# EasyEDA Pro project ProPrj_bizhang car_2026-04-26.epro

# Schematic Schematic1
Board Name: Board1; Create Date: 2025-07-30; Page Name: P1; Project Name: bizhang car; Schematic Name: Schematic1; Update Date: 2025-08-14; BladeWidth: 10; Company: 嘉立创EDA; Page Size: A4; RegionStart: 1; ShowBorder: 1; TitleBlock: 1; TitleBlockPosition: 3; Version: V1.0; XRegionCount: 6; YRegionCount: 4
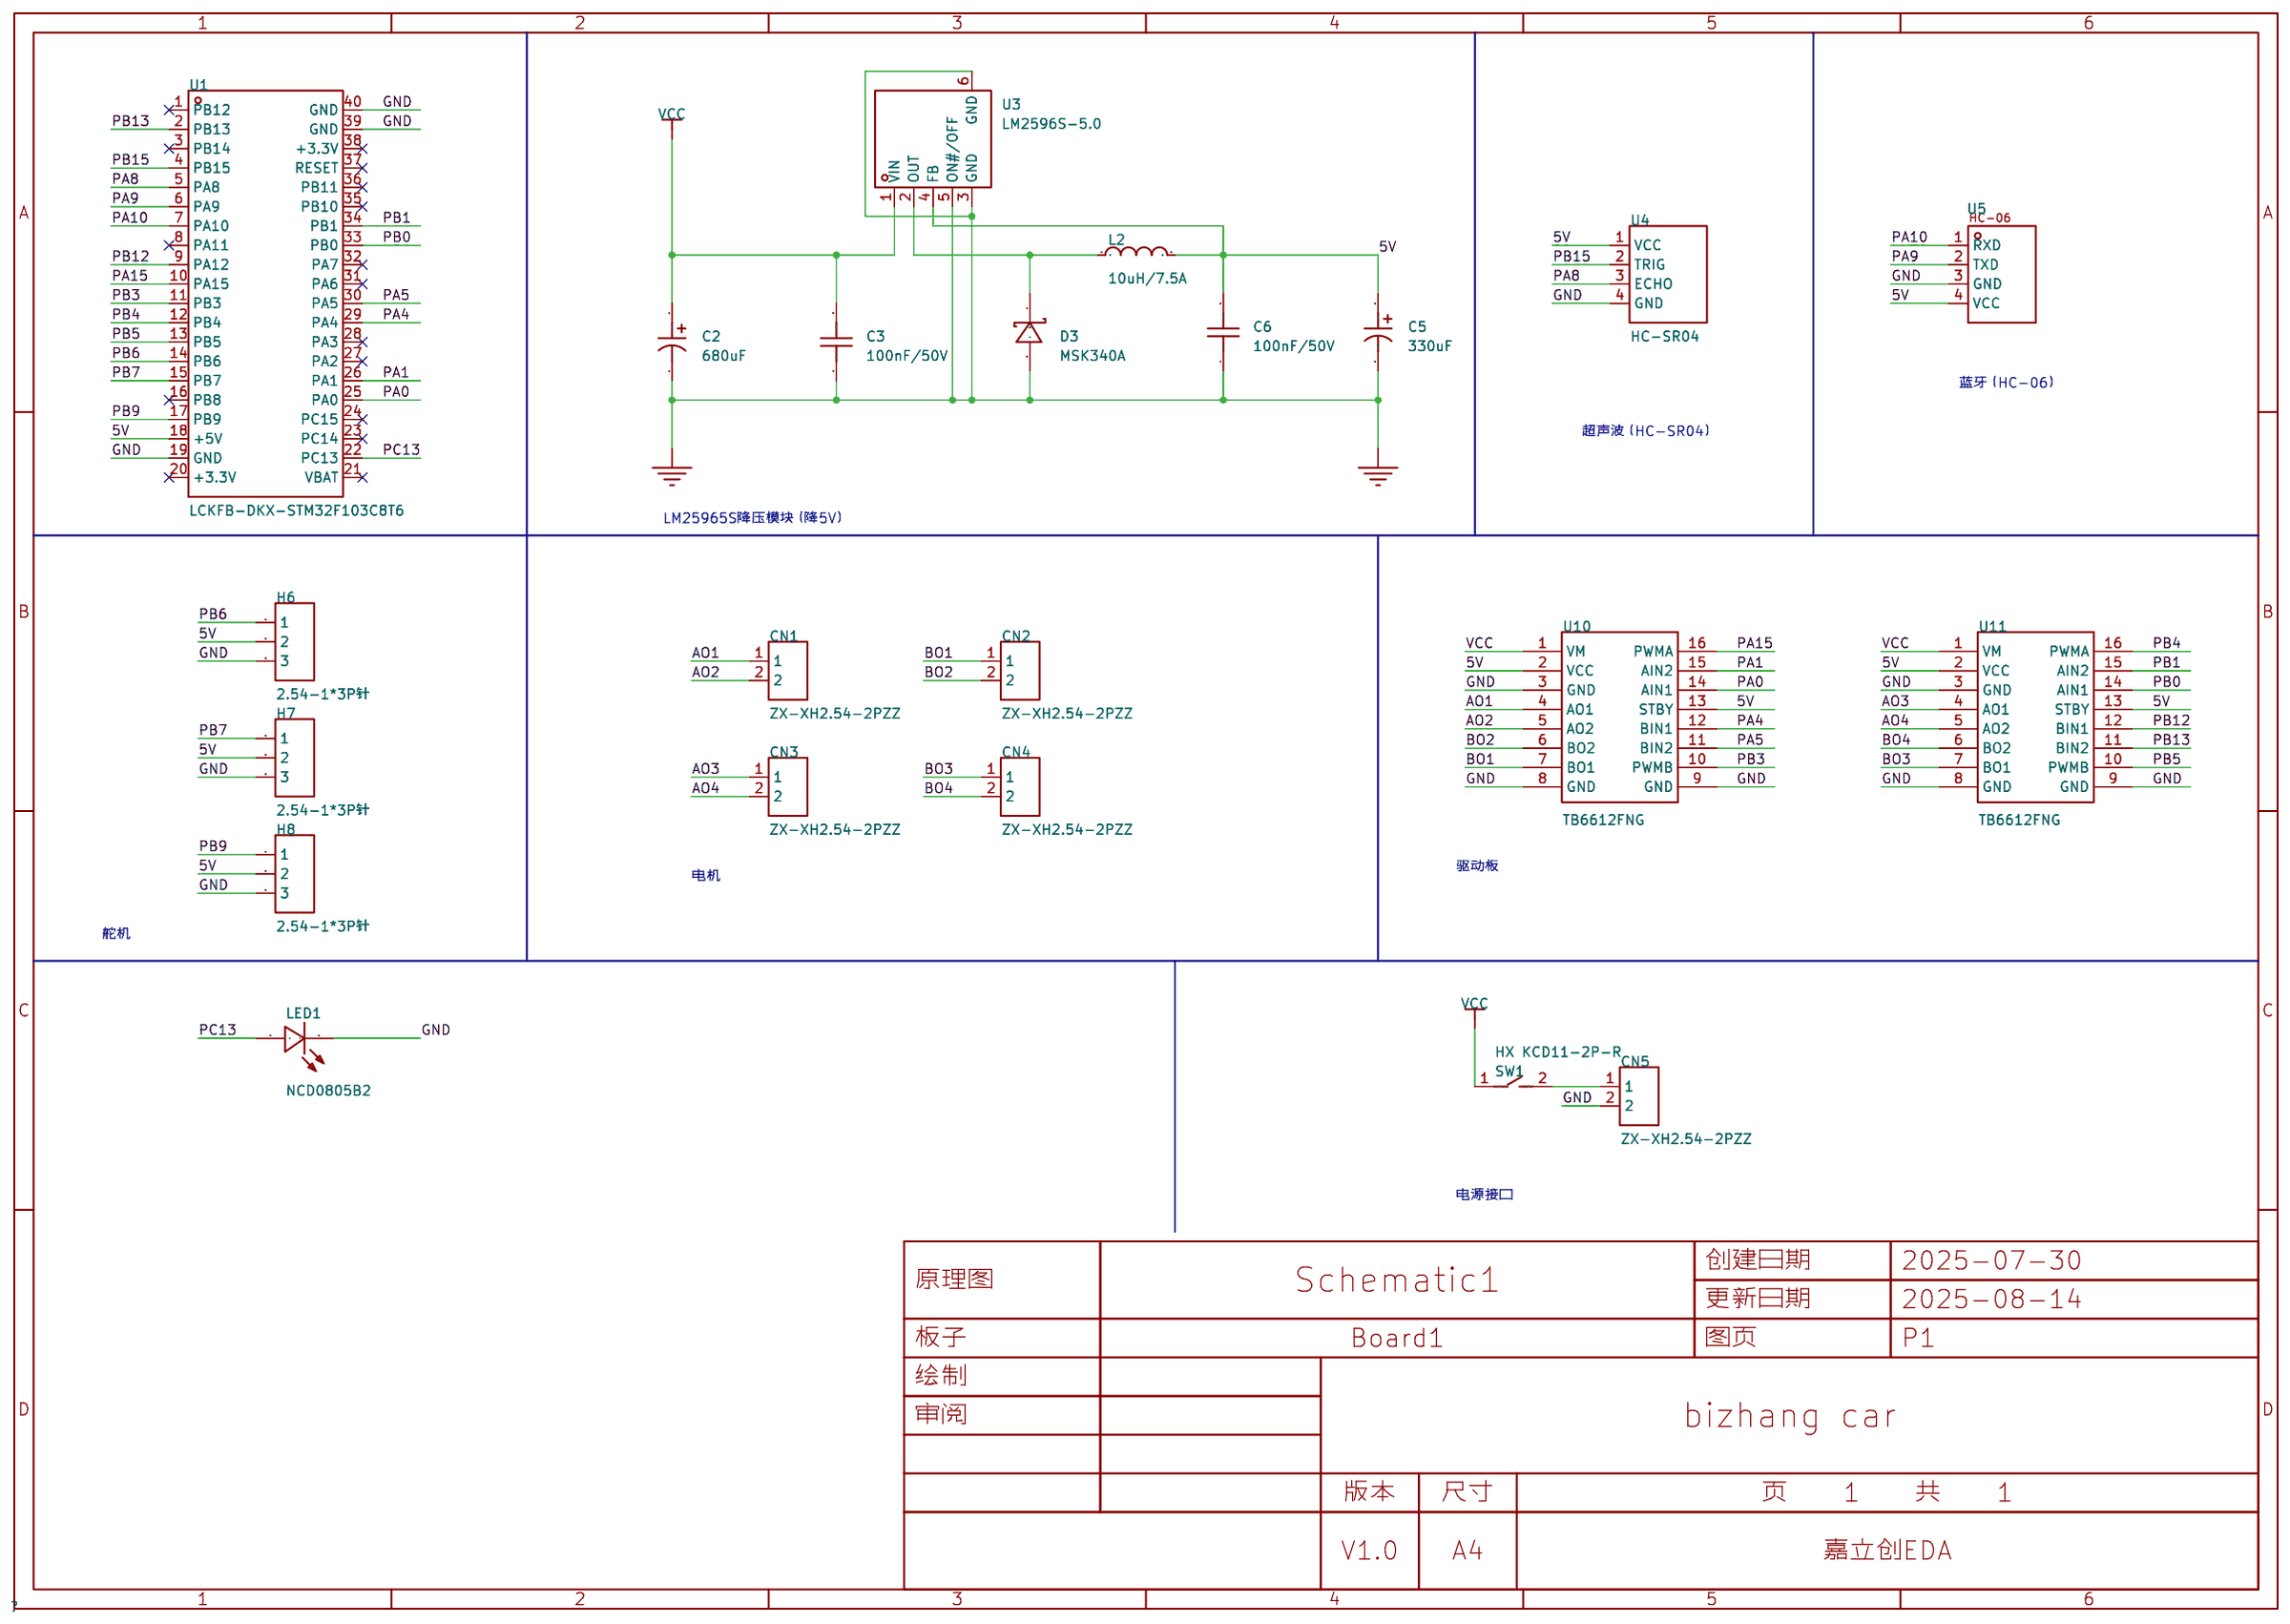
[diagram p0: schematic sheet]

## Parts
C2  680uF  [CAP-TH_BD13.0-P5.00-D0.6-FD]
C3  100nF/50V  [C0805]
C5  330uF  [CAP-TH_BD8.0-P3.50-D0.6-FD]
C6  100nF/50V  [C0805]
CN1  ZX-XH2.54-2PZZ  [CONN-TH_2P-P2.50_HX25003-2A]
CN2  ZX-XH2.54-2PZZ  [CONN-TH_2P-P2.50_HX25003-2A]
CN3  ZX-XH2.54-2PZZ  [CONN-TH_2P-P2.50_HX25003-2A]
CN4  ZX-XH2.54-2PZZ  [CONN-TH_2P-P2.50_HX25003-2A]
CN5  ZX-XH2.54-2PZZ  [CONN-TH_2P-P2.50_HX25003-2A]
D3  MSK340A  [SMA_L4.4-W2.6-LS5.0-RD]
H6  2.54-1*3P针  [HDR-TH_3P-P2.54-V-M-1]
H7  2.54-1*3P针  [HDR-TH_3P-P2.54-V-M-1]
H8  2.54-1*3P针  [HDR-TH_3P-P2.54-V-M-1]
L2  10uH/7.5A  [IND-SMD_L11.0-W10.2]
LED1  NCD0805B2  [LED0805-R-RD]
SW1  HX KCD11-2P-R  [SW-TH_2P-L15.0-W10.5-P5.00_KCD11-2P-R]
U1  LCKFB-DKX-STM32F103C8T6  [CONN-TH_L53.3-W22.9_STM32F103C8T6-CARD]
U3  LM2596S-5.0  [TO-263-5_L10.1-W8.7-P1.70-LS15.2-BR]
U4  HC-SR04  [TH_HC-SR04V]
U5  -  [HC-06]
U10  TB6612FNG  [TB6612FNG]
U11  TB6612FNG  [TB6612FNG]

## Library data of the parts
C2 = ERG50V680M13X21: 容值:680uF;精度:±20%;额定电压:50V;纹波电流:2.18A@100kHz;等效串联电阻(ESR):30mΩ@100kHz;; LCSC Part Name: 680uF ±20% 50V; Supplier Part: C48935384; Manufacturer: 捷而瑞; Supplier Footprint: 插件,D13xL21mm; JLCPCB Part Class: 扩展库; Datasheet: https://atta.szlcsc.com/upload/public/pdf/source/20250526/717B4C76834FE5C4A331D19A222D031C.pdf; Supplier: LCSC; Tolerance: ±20%; Voltage Rating: 50V; Ripple Current: 2.18A@100kHz; Equivalent Series Resistance(ESR): 30mΩ@100kHz; Pin Spacing: 5mm; Diameter: 13mm; Height - Seated (Max): 21mm; Lifetime: 2000hrs@105℃; Operating Temperature: -40℃~+105℃
C3 C6 = CAP_0805: Supplier Footprint: 0805
C5 = ERG25V330M8X12: 容值:330uF;精度:±20%;额定电压:25V;纹波电流:760mA@100kHz;等效串联电阻(ESR):87mΩ@100kHz;; LCSC Part Name: 330uF ±20% 25V; Supplier Part: C47344178; Manufacturer: 捷而瑞; Supplier Footprint: 插件,D8xL12mm; JLCPCB Part Class: 扩展库; Datasheet: https://atta.szlcsc.com/upload/public/pdf/source/20250526/717B4C76834FE5C4A331D19A222D031C.pdf; Supplier: LCSC; Tolerance: ±20%; Voltage Rating: 25V; Ripple Current: 760mA@100kHz; Equivalent Series Resistance(ESR): 87mΩ@100kHz; Pin Spacing: 3.5mm; Diameter: 8mm; Height - Seated (Max): 12mm; Lifetime: 2000hrs@105℃; Operating Temperature: -40℃~+105℃
CN1-CN5 = ZX-XH2.54-2PZZ: 插针结构:1x2P;间距:2.5mm;安装方式:直插;参考系列:XH;总PIN数:2P;排数:1;每排PIN数:2;行距:-;额定电流:3A;触头材质:黄铜;触头镀层:锡;工作温度:-25℃~+85℃;; LCSC Part Name: 1x2P 间距:2.5mm 直插 系列:XH; Supplier Part: C7429632; Manufacturer: Megastar(兆星); Supplier Footprint: 插件,P=2.5mm; JLCPCB Part Class: 扩展库; Datasheet: https://item.szlcsc.com/datasheet/ZX-XH2.54-2PZZ/8427549.html; Supplier: LCSC; Pins Structure: 1x2P; Pitch: 2.5mm; Mounting Type: 直插; Reference Series: XH; Number of Pins: 2P; Number of Rows: 1; Number of PINs Per Row: 2; Current Rating: 3A; Contact Material: 黄铜; Contact Plating: 锡; Operating Temperature: -25℃~+85℃; Voltage Rating: 250V; Plastic Material: PA66; Flame Retardant Rating: UL94V-0; Color: 白色; Z-Height of the Board: 7mm; X-Length of Bottom Edge on Board (Spacing Line): 7.5mm; Y-Width of Bottom Edge on Board: 5.9mm
D3 = MSK340A: 二极管配置:独立式;正向压降(Vf):460mV@5A;直流反向耐压(Vr):50V;平均整流电流(Io):5A;; LCSC Part Name: 电压:50V 电流:5A; Supplier Part: C434027; Manufacturer: SHIKUES(时科); Supplier Footprint: SMA; JLCPCB Part Class: Extended Part; Datasheet: https://atta.szlcsc.com/upload/public/pdf/source/20190930/C434027_5C5A86DE184FCFA78FE7494E76FEF79C.pdf; Supplier: LCSC; Diode Configuration: 独立式; Forward Voltage (Vf@If): 460mV@5A; Reverse Voltage (Vr): 50V; Average Rectified Current (Io): 5A; Reverse Leakage Current (Ir): 50uA@50V
H6-H8 = 2.54-1*3P针: 插针结构:1x3P;间距:2.54mm;行距:-;圆针/方针:方针;安装类型:直插;排数:单排;总PIN位数:3P;额定电流:3A;额定电压:-;配合针长度:-;塑高:-;端接针长度:-;触头材质:-;触头镀层:-;工作温度范围:-40℃~+105℃;颜色:黑色;; LCSC Part Name: 间距:2.54mm 1x3P 直插 方针; Supplier Part: C49257; Manufacturer: BOOMELE(博穆精密); Supplier Footprint: 插件,P=2.54mm; JLCPCB Part Class: 扩展库; Datasheet: https://atta.szlcsc.com/upload/public/pdf/source/20221018/3E9408392E35E6F57A28985E5F7BF5C9.pdf; Supplier: LCSC; Pin Structure: 1x3P; Pitch: 2.54mm; Circluar Pins/Square Pins: 方针; Mounting Type: 直插; Number of Rows: 单排; Number of Pins: 3P; Current Rating (Max): 3A; Operating Temperature Range: -40℃~+105℃; Color: 黑色
L2 = SL1040-100M: 电感值:10uH;精度:±20%;额定电流:7.5A;饱和电流(Isat):8A;; LCSC Part Name: 10uH ±20% 8A; Supplier Part: C22463839; Manufacturer: 台湾陆海; Supplier Footprint: SMD,11x10.5mm; JLCPCB Part Class: 扩展库; Datasheet: https://atta.szlcsc.com/upload/public/pdf/source/20240611/8DE7D6BE1273F2E871C82A6D5C20B08D.pdf; Supplier: LCSC; Tolerance: ±20%; Current Rating: 7.5A; Current - Saturation (Isat): 8A
LED1 = NCD0805B2: 发光颜色:蓝色;正向电压(VF):2.5V~3.6V;功率:72mW;正向电流:2mA;主波长:468nm~478nm;透镜颜色:无色透明透镜;发光强度:20mcd~55mcd;发光角度:130°;工作温度:-30℃~+85℃;; Supplier Part: C84259; Manufacturer: 国星光电; Supplier Footprint: 0805; JLCPCB Part Class: 扩展库; Datasheet: https://atta.szlcsc.com/upload/public/pdf/source/20200820/C84259_E5AC6865415989C4C2C2831134BA3A23.pdf; Supplier: LCSC; Emitted Color: 蓝色; Forward Voltage (VF): 2.5V~3.6V; Power Dissipation: 72mW; Forward Current: 2mA; Dominant Wavelength: 468nm~478nm; Lens Color: 无色透明透镜; Luminous Intensity: 20mcd~55mcd; Viewing Angle: 130°; Operating Temperature: -30℃~+85℃
SW1 = HX KCD11-2P-R: 带灯:无;引脚样式:焊片;额定电流:3A;额定电压(AC):250V;电路结构:单刀单掷;工作寿命:1万次;; LCSC Part Name: 10.5*15mm 两脚两档跷板开关 红钮; Supplier Part: C6917318; Manufacturer: hanxia(韩下); Supplier Footprint: 插件; JLCPCB Part Class: 扩展库; Datasheet: https://atta.szlcsc.com/upload/public/pdf/source/20230526/CAA555F1CB670B015E4FF3F7F6A5662A.pdf; Supplier: LCSC; With Lamp: 无; Termination Style: 焊片; Actuator Color: 红色; Current Rating: 3A; Voltage Rating (AC): 250V; Circuit: 单刀单掷; Life: 1万次
U1 = LCKFB-DKX-STM32F103C8T6: LCSC Part Name: 立创·地阔星-STM32F103C8T6开发板; Supplier Part: C22396880; Manufacturer: 立创开发板; JLCPCB Part Class: 扩展库; Datasheet: https://atta.szlcsc.com/upload/public/pdf/source/20241206/D7467B743BEDB0C7B9E08FA0EBB7E773.pdf; Supplier: LCSC
U3 = LM2596S-5.0_C5276750: 功能类型:降压型;输出类型:固定;工作电压:-;输出电压:5V;输出电流:-;; LCSC Part Name: 3A降压电压调节器; Supplier Part: C5276750; Manufacturer: TWGMC(台湾迪嘉); Supplier Footprint: TO-263-5; JLCPCB Part Class: 扩展库; Datasheet: https://atta.szlcsc.com/upload/public/pdf/source/20221121/BE66229392871E6008E3503EDFD620B9.pdf; Supplier: LCSC; Function: 降压型; Output Type: 固定; Output Voltage: 5V; Switching Frequency: 150kHz; Operating Temperature: -40℃~+125℃; Number of Outputs: 1; Topology: 降压式
U4 = HC-SR04: Supplier Part: C19857336; Manufacturer: Universal Microelectronics; JLCPCB Part Class: 扩展库; Datasheet: https://atta.szlcsc.com/upload/public/pdf/source/20240122/47B8E374E428935B7962A2189EF91AAC.pdf; Supplier: LCSC
U5 = HC-06: 蓝牙模块-4P; _: 3
U10 U11 = TB6612FNG

## Nets
5V: C5.1 C6.2 H6.2 H7.2 H8.2 L2.2 U1.18(+5V) U3.4(FB) U4.1(VCC) U5.4(VCC) U10.2(VCC) U10.13(STBY) U11.2(VCC) U11.13(STBY)
GND: C2.2 C3.1 C5.2 C6.1 CN5.2 D3.2(A) H6.3 H7.3 H8.3 LED1.2(-) U1.19(GND) U1.39(GND) U1.40(GND) U3.3(GND) U3.5(ON#/OFF) U3.6(GND) U4.4(GND) U5.3(GND) U10.3(GND) U10.8(GND) U10.9(GND) U11.3(GND) U11.8(GND) U11.9(GND)
VCC: C2.1 C3.2 SW1.1 U3.1(VIN) U10.1(VM) U11.1(VM)
AO1: CN1.1 U10.4(AO1)
AO2: CN1.2 U10.5(AO2)
AO3: CN3.1 U11.4(AO1)
AO4: CN3.2 U11.5(AO2)
BO1: CN2.1 U10.7(BO1)
BO2: CN2.2 U10.6(BO2)
BO3: CN4.1 U11.7(BO1)
BO4: CN4.2 U11.6(BO2)
PA0: U1.25(PA0) U10.14(AIN1)
PA1: U1.26(PA1) U10.15(AIN2)
PA4: U1.29(PA4) U10.12(BIN1)
PA5: U1.30(PA5) U10.11(BIN2)
PA8: U1.5(PA8) U4.3(ECHO)
PA9: U1.6(PA9) U5.2(TXD)
PA10: U1.7(PA10) U5.1(RXD)
PA15: U1.10(PA15) U10.16(PWMA)
PB0: U1.33(PB0) U11.14(AIN1)
PB1: U1.34(PB1) U11.15(AIN2)
PB3: U1.11(PB3) U10.10(PWMB)
PB4: U1.12(PB4) U11.16(PWMA)
PB5: U1.13(PB5) U11.10(PWMB)
PB6: H6.1 U1.14(PB6)
PB7: H7.1 U1.15(PB7)
PB9: H8.1 U1.17(PB9)
PB12: U1.9(PA12) U11.12(BIN1)
PB13: U1.2(PB13) U11.11(BIN2)
PB15: U1.4(PB15) U4.2(TRIG)
PC13: LED1.1(+) U1.22(PC13)
$1N1207: D3.1(C) L2.1 U3.2(OUT)
$1N6220: CN5.1 SW1.2

Not connected (* = marked no-connect by the designer): U1 1(PB12)* 3(PB14)* 8(PA11)* 16(PB8)* 20(+3.3V)* 21(VBAT)* 23(PC14)* 24(PC15)* 27(PA2)* 28(PA3)* 31(PA6)* 32(PA7)* 35(PB10)* 36(PB11)* 37(RESET)* 38(+3.3V)*

## Notes on the sheet
- 蓝牙（HC-06）
- 超声波（HC-SR04）
- LM25965S降压模块（降5V）
- 电机
- 驱动板
- 舵机
- 电源接口

# Schematic Schematic2
Board Name: PCB2; Create Date: 2025-08-19; Page Name: P1; Project Name: bizhang car; Schematic Name: Schematic2; Update Date: 2025-08-19; BladeWidth: 10; Company: 嘉立创EDA; Page Size: A4; RegionStart: 1; ShowBorder: 1; TitleBlock: 1; TitleBlockPosition: 3; Version: V1.0; XRegionCount: 6; YRegionCount: 4
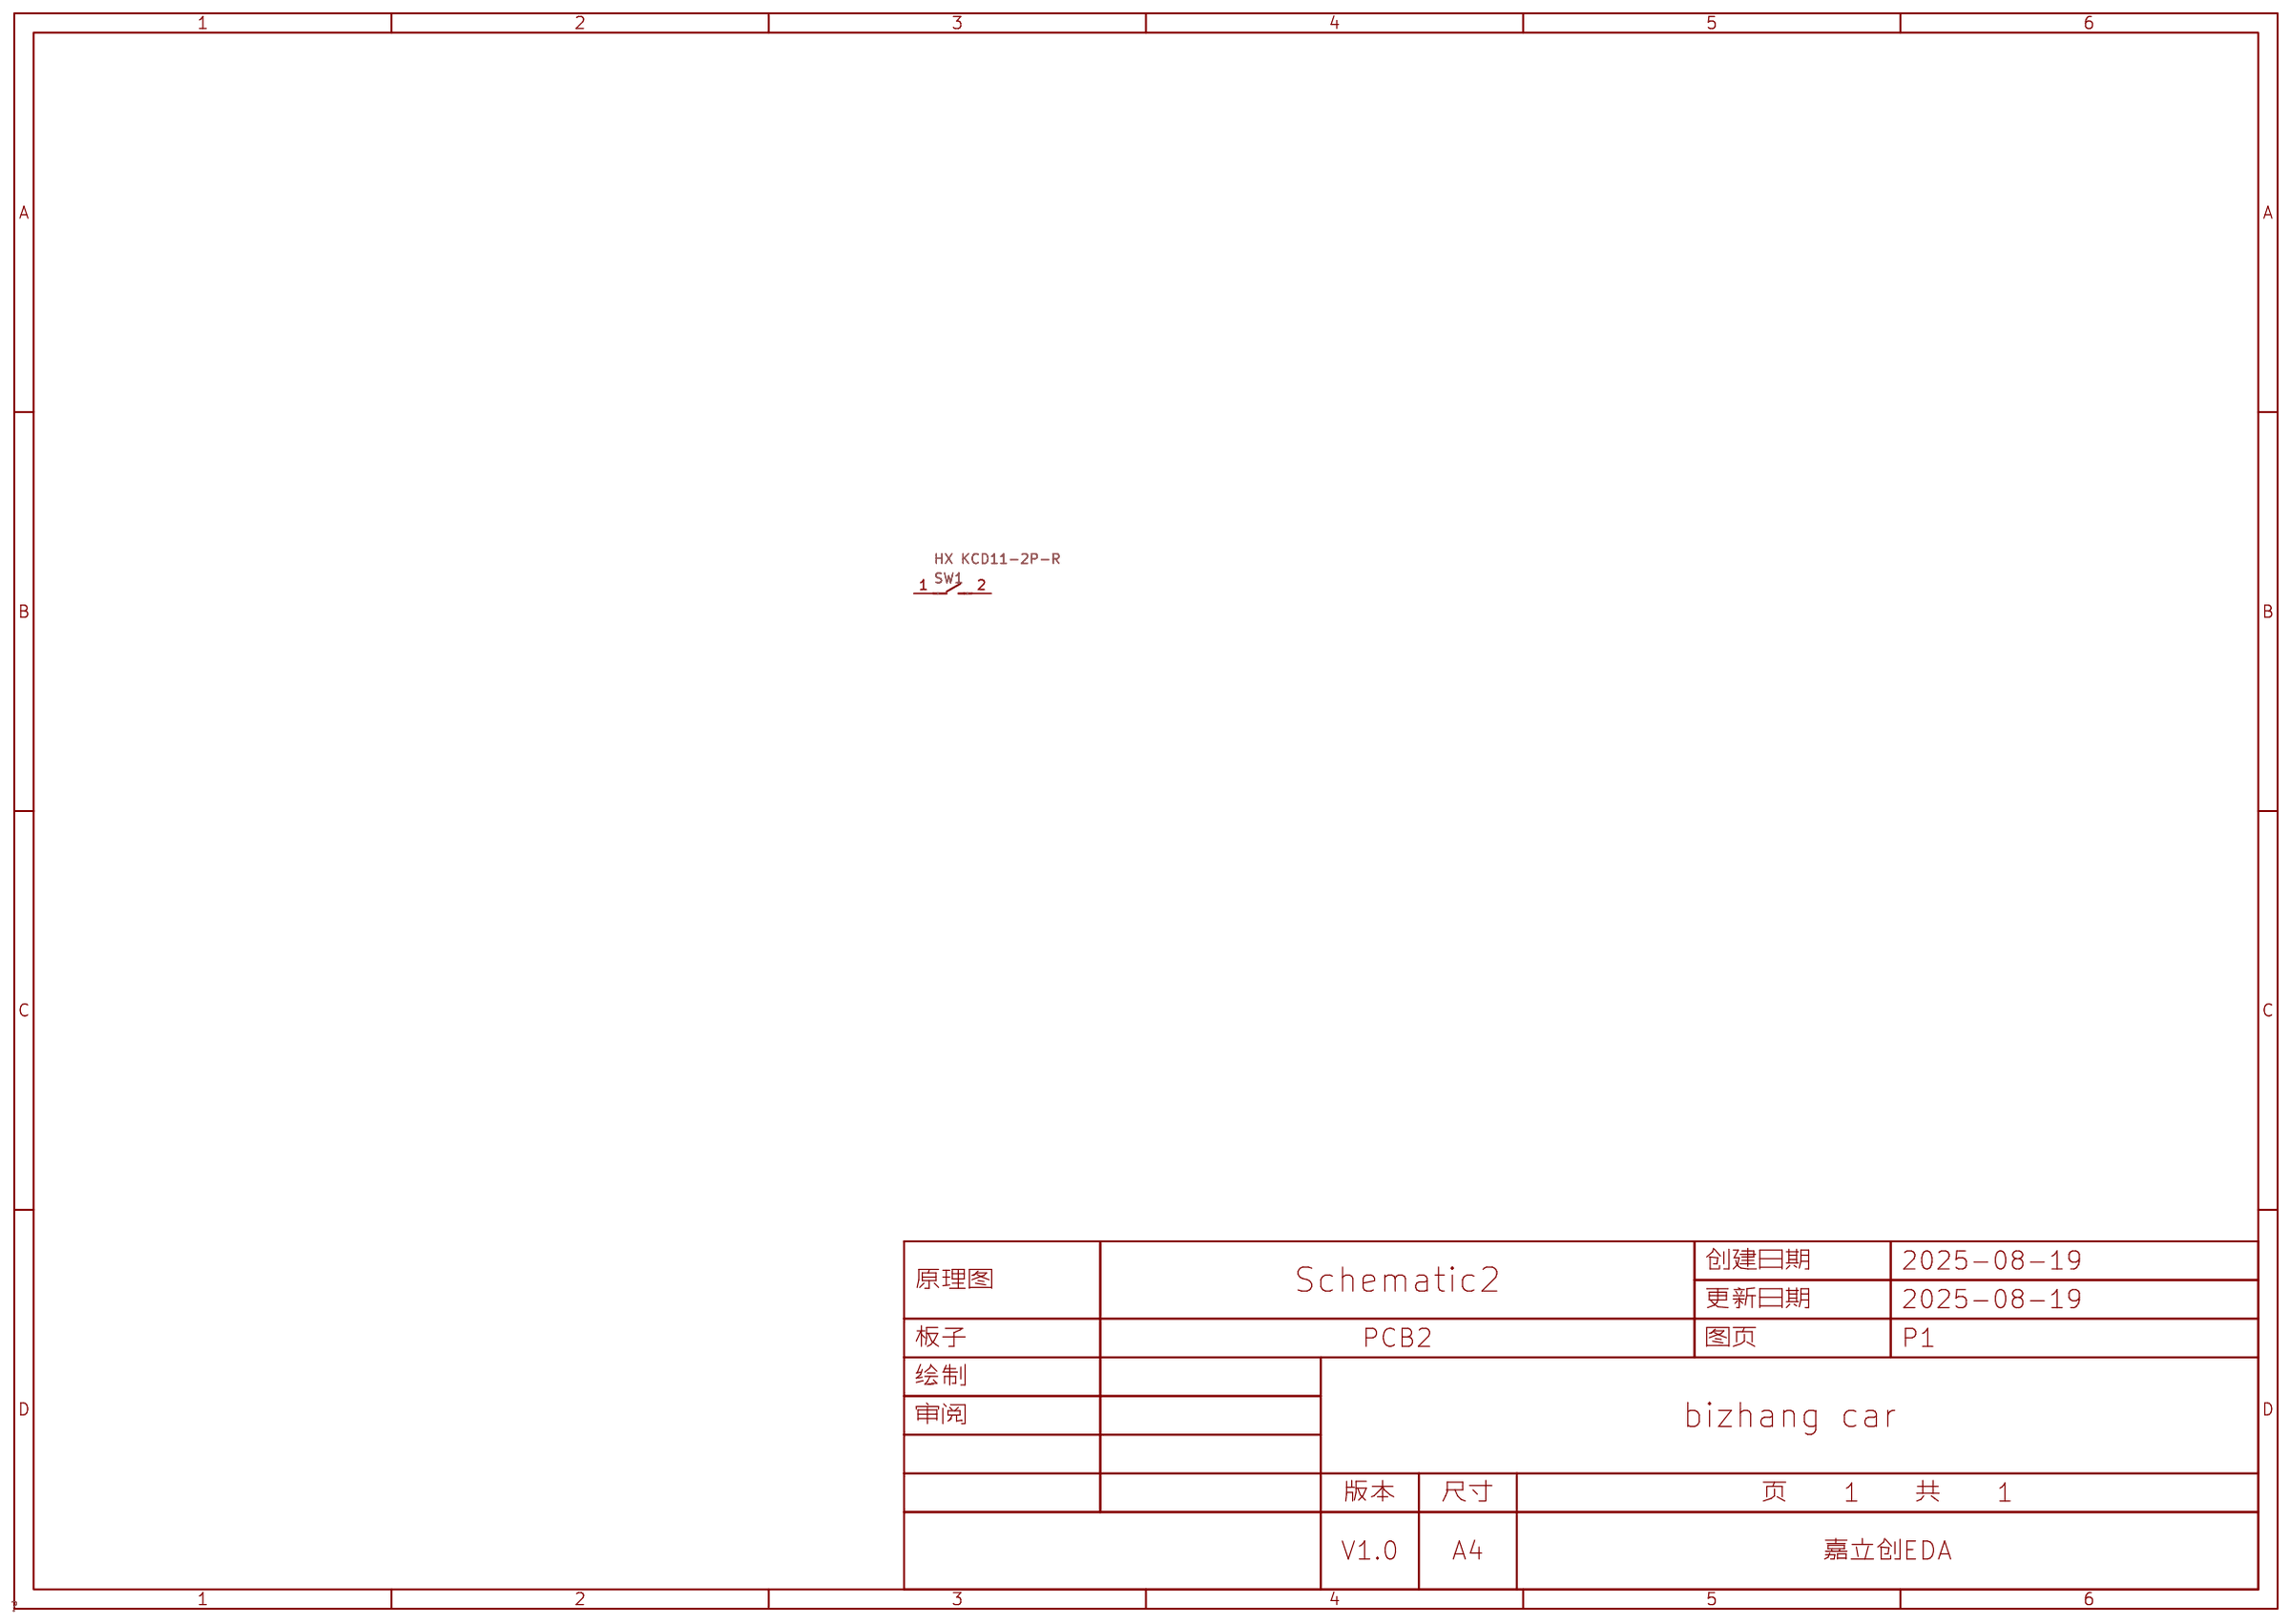
[diagram p1: schematic sheet]

## Parts
SW1  HX KCD11-2P-R  [SW-TH_2P-L15.0-W10.5-P5.00_KCD11-2P-R]

## Library data of the parts
SW1 = HX KCD11-2P-R: 带灯:无;引脚样式:焊片;额定电流:3A;额定电压(AC):250V;电路结构:单刀单掷;工作寿命:1万次;; LCSC Part Name: 10.5*15mm 两脚两档跷板开关 红钮; Supplier Part: C6917318; Manufacturer: hanxia(韩下); Supplier Footprint: 插件; JLCPCB Part Class: 扩展库; Datasheet: https://atta.szlcsc.com/upload/public/pdf/source/20230526/CAA555F1CB670B015E4FF3F7F6A5662A.pdf; Supplier: LCSC; With Lamp: 无; Termination Style: 焊片; Actuator Color: 红色; Current Rating: 3A; Voltage Rating (AC): 250V; Circuit: 单刀单掷; Life: 1万次

## Nets

Not connected (* = marked no-connect by the designer): SW1 1 2

# Board PCB1
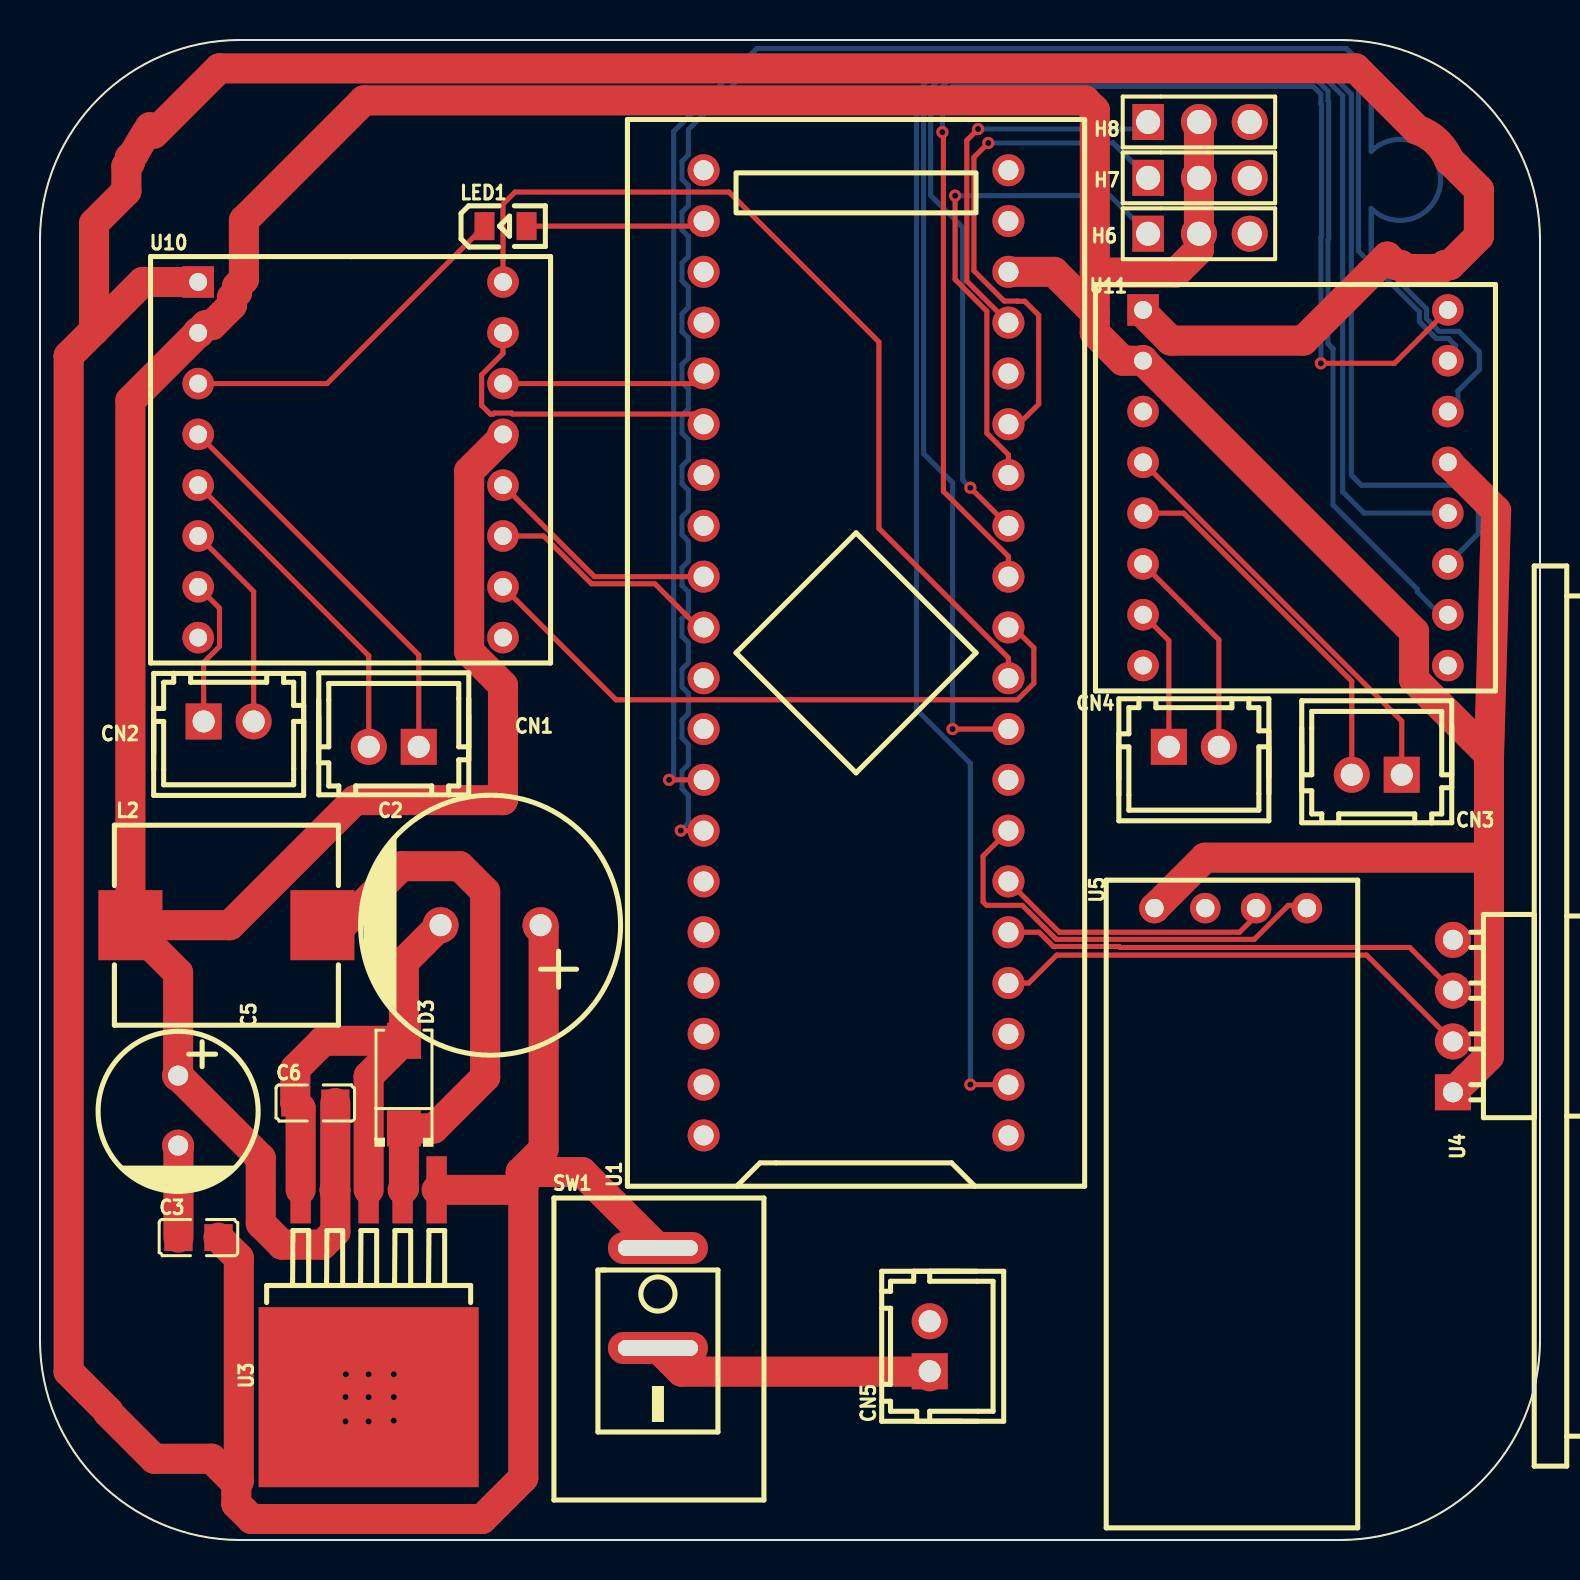
[diagram p2: board, top side]
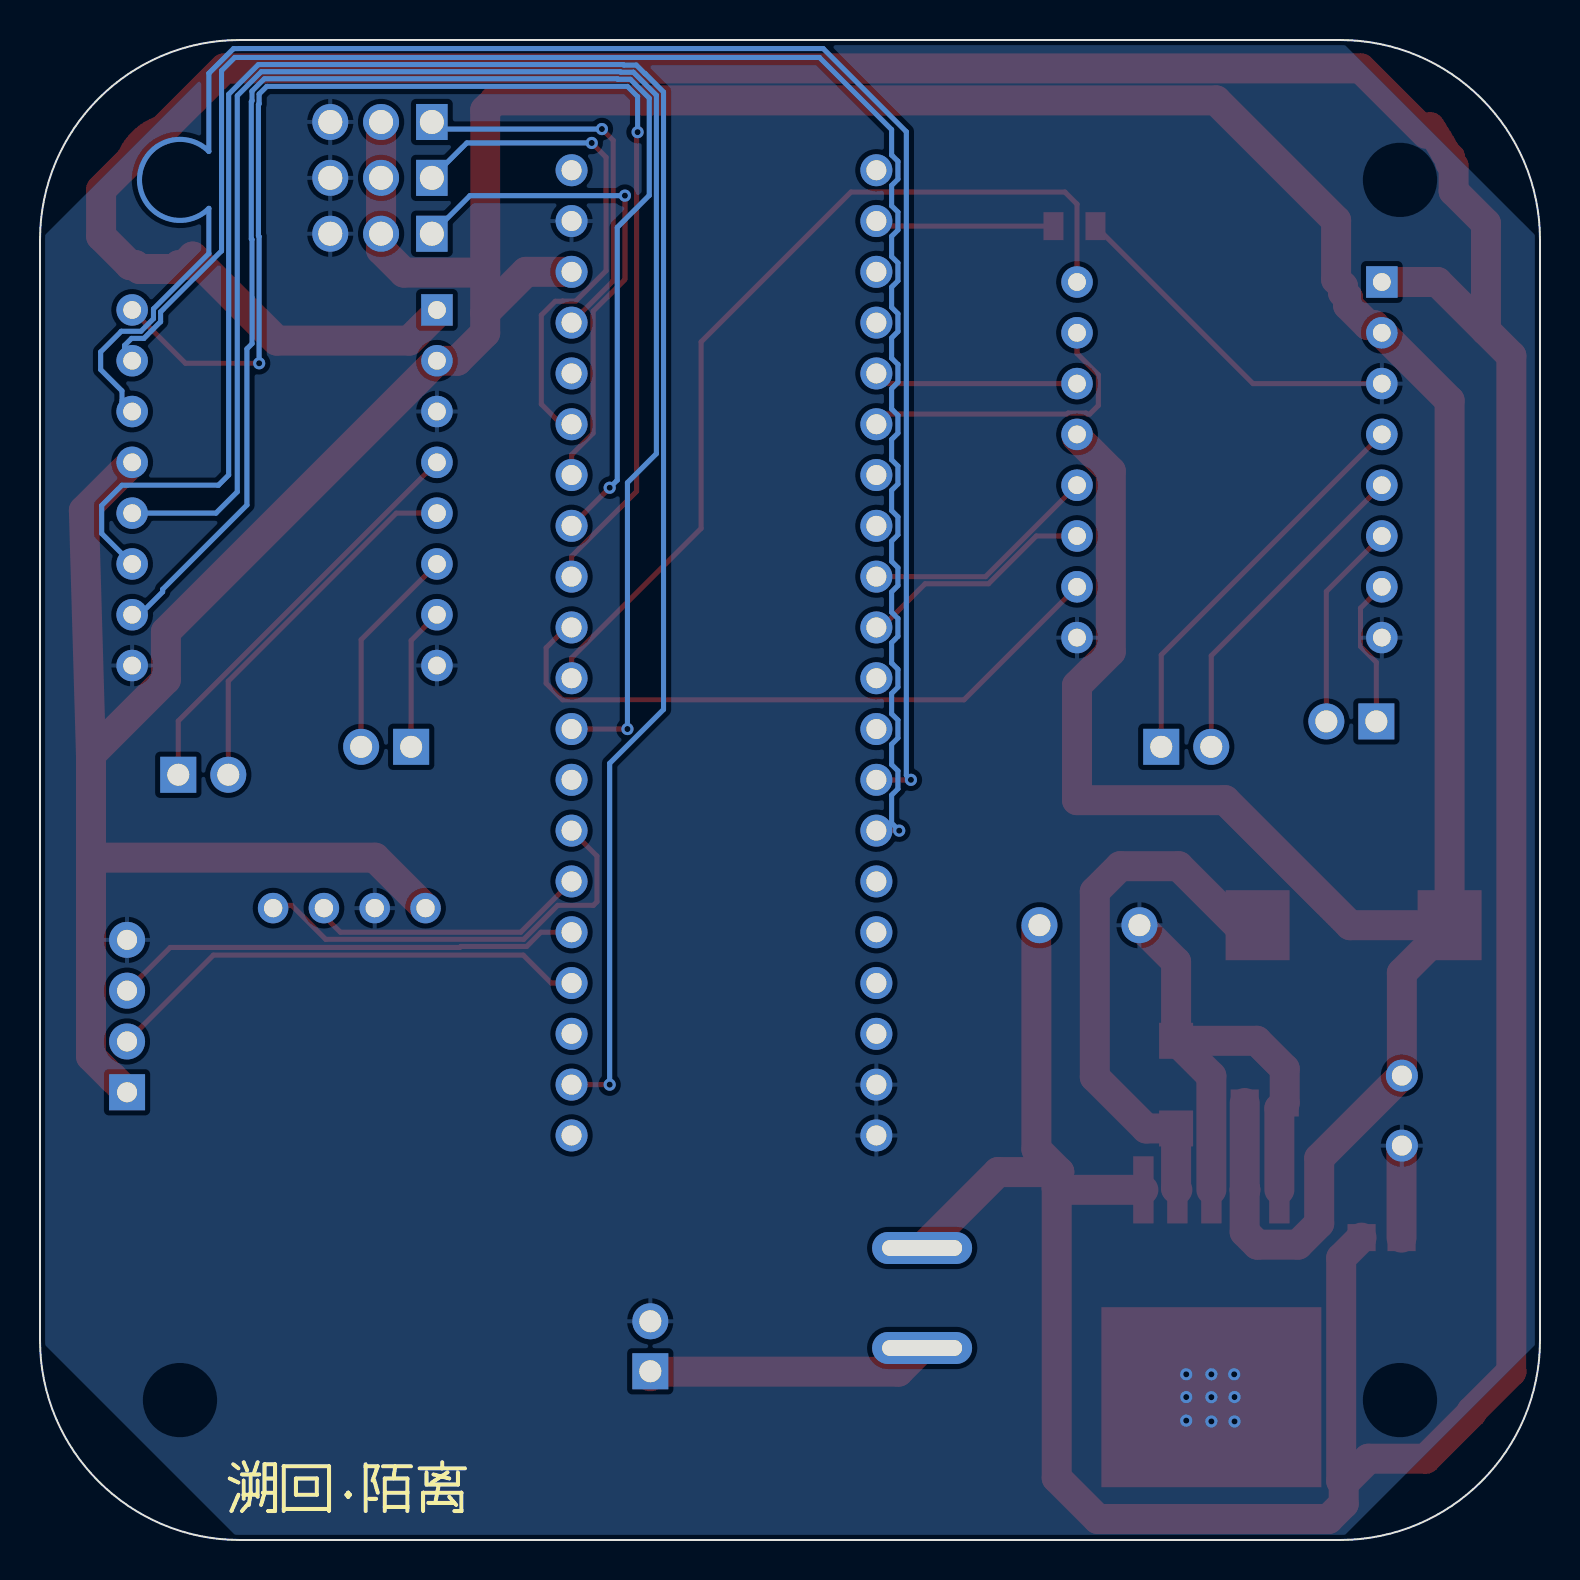
[diagram p3: board, bottom side, seen from below]

Outline 75 x 75 mm; copper layers: Top Layer, Bottom Layer. Coordinates in mm from the lower left corner of the outline.
Outline path: 0,65 arc(2.93,72.07) 10,75 65,75 arc(72.07,72.07) 75,65 75,10 arc(72.07,2.93) 65,0 10,0 arc(2.93,2.93) 0,10 0,65
Stack: Top Layer 0.035mm / Dielectric1 1.51mm FR4 er 4.5 / Bottom Layer 0.035mm

## Design rules (mm)
spacing copperThickness1oz (default): track to track 0.102, other pairs 0.152 to 0.3
spacing copperThickness2oz: track to track 0.203, other pairs 0.152 to 0.3
spacing Plane_innerPlane: track to track 0.102, other pairs 0.152 to 0.3
spacing Copper_copperRegion: track to track 0.102, other pairs 0.152 to 0.3
track width copperThickness1oz (default): min 0.127, default 0.254, max 2.54
track width copperThickness2oz: min 0.203, default 0.254, max 2.54
differential pair differentialPair (default): width min 0.127, default 0.254, max 2.54; gap min 0.152, default 0.152
pour e416 uses Copper_copperRegion

## Placement (name value [footprint] x y rotation side)
C2  680uF  [CAP-TH_BD13.0-P5.00-D0.6-FD]  22.53 30.74 180 top
C3  100nF/50V  [C0805]  7.92 15.12 0 top
C5  330uF  [CAP-TH_BD8.0-P3.50-D0.6-FD]  6.91 21.47 270 top
C6  100nF/50V  [C0805]  13.76 21.85 0 top
CN1  ZX-XH2.54-2PZZ  [CONN-TH_2P-P2.50_HX25003-2A]  17.69 39.66 180 top
CN2  ZX-XH2.54-2PZZ  [CONN-TH_2P-P2.50_HX25003-2A]  9.43 40.93 0 top
CN3  ZX-XH2.54-2PZZ  [CONN-TH_2P-P2.50_HX25003-2A]  66.84 38.26 180 top
CN4  ZX-XH2.54-2PZZ  [CONN-TH_2P-P2.50_HX25003-2A]  57.69 39.66 0 top
CN5  ZX-XH2.54-2PZZ  [CONN-TH_2P-P2.50_HX25003-2A]  44.48 9.69 90 top
D3  MSK340A  [SMA_L4.4-W2.6-LS5.0-RD]  18.2 22.77 90 top
H6  2.54-1*3P针  [HDR-TH_3P-P2.54-V-M-1]  57.95 65.31 0 top
H7  2.54-1*3P针  [HDR-TH_3P-P2.54-V-M-1]  57.95 68.11 0 top
H8  2.54-1*3P针  [HDR-TH_3P-P2.54-V-M-1]  57.95 70.9 0 top
L2  10uH/7.5A  [IND-SMD_L11.0-W10.2]  9.32 30.74 180 top
LED1  NCD0805B2  [LED0805-R-RD]  23.28 65.69 0 top
SW1  HX KCD11-2P-R  [SW-TH_2P-L15.0-W10.5-P5.00_KCD11-2P-R]  30.9 12.1 270 top
U1  LCKFB-DKX-STM32F103C8T6  [CONN-TH_L53.3-W22.9_STM32F103C8T6-CARD]  40.8 44.36 90 top
U3  LM2596S-5.0  [TO-263-5_L10.1-W8.7-P1.70-LS15.2-BR]  16.43 12.33 90 top
U4  HC-SR04  [TH_HC-SR04V]  70.65 26.2 90 top
U5  -  [HC-06]  59.6 16.8 0 top
U10  -  [TB6612FNG]  7.91 62.9 0 top
U11  -  [TB6612FNG]  55.15 61.5 0 top

## Footprints (pads in the part's own frame, mm; a bottom-side part is the same pattern mirrored in y, then rotated)
C0805
  rect 1.41x1.35 smd: 1(-1,0) 2(1,0)
CAP-TH_BD8.0-P3.50-D0.6-FD
  round 1.6 hole 1: 1(-1.75,0) 2(1.75,0)
CAP-TH_BD13.0-P5.00-D0.6-FD
  round 1.8 hole 1.1: 1(-2.5,0) 2(2.5,0)
CONN-TH_2P-P2.50_HX25003-2A
  rect 1.8x1.8 hole 1.1: 1(-1.25,0)
  round 1.8 hole 1.1: 2(1.25,0)
CONN-TH_L53.3-W22.9_STM32F103C8T6-CARD
  round 1.6 hole 1: 1(-24.13,-7.62) 2(-21.59,-7.62) 3(-19.05,-7.62) 4(-16.51,-7.62) 5(-13.97,-7.62) 6(-11.43,-7.62) 7(-8.89,-7.62) 8(-6.35,-7.62) 9(-3.81,-7.62) 10(-1.27,-7.62) 11(1.27,-7.62) 12(3.81,-7.62) 13(6.35,-7.62) 14(8.89,-7.62) 15(11.43,-7.62) 16(13.97,-7.62) 17(16.51,-7.62) 18(19.05,-7.62) 19(21.59,-7.62) 20(24.13,-7.62) 21(24.13,7.62) 22(21.59,7.62) 23(19.05,7.62) 24(16.51,7.62) 25(13.97,7.62) 26(11.43,7.62) 27(8.89,7.62) 28(6.35,7.62) 29(3.81,7.62) 30(1.27,7.62) 31(-1.27,7.62) 32(-3.81,7.62) 33(-6.35,7.62) 34(-8.89,7.62) 35(-11.43,7.62) 36(-13.97,7.62) 37(-16.51,7.62) 38(-19.05,7.62) 39(-21.59,7.62) 40(-24.13,7.62)
HC-06
  round 1.524 hole 0.914: 1(3.747,14.796) 2(1.206,14.796) 3(-1.333,14.796) 4(-3.873,14.796)
HDR-TH_3P-P2.54-V-M-1
  rect 1.575x1.8 hole 1.2: 1(-2.54,0)
  round 1.8 hole 1.2: 2(0,0) 3(2.54,0)
IND-SMD_L11.0-W10.2
  rect 3.2x3.5 smd: 1(-4.8,0) 2(4.8,0)
LED0805-R-RD
  rect 1x1.399 smd: 1(1.05,0) 2(-1.05,0)
SMA_L4.4-W2.6-LS5.0-RD
  rect 1.8x1.7 smd: 1(-2.192,0) 2(2.192,0)
SW-TH_2P-L15.0-W10.5-P5.00_KCD11-2P-R
  oval 1.6x5 hole 0.8x4: 1(-2.5,0) 2(2.5,0)
TB6612FNG
  rect 1.575x1.575 hole 0.889: 1(0,0)
  round 1.575 hole 0.889: 2(0,-2.54) 3(0,-5.08) 4(0,-7.62) 5(0,-10.16) 6(0,-12.7) 7(0,-15.24) 8(0,-17.78) 9(15.24,-17.78) 10(15.24,-15.24) 11(15.24,-12.7) 12(15.24,-10.16) 13(15.24,-7.62) 14(15.24,-5.08) 15(15.24,-2.54) 16(15.24,0)
TH_HC-SR04V
  rect 1.8x1.8 hole 1.001: 1(-3.81,0)
  round 1.8 hole 1.001: 2(-1.27,0) 3(1.27,0) 4(3.81,0)
TO-263-5_L10.1-W8.7-P1.70-LS15.2-BR
  rect 3.358x1.02 smd: 1(5.183,-3.4) 2(5.183,-1.7) 3(5.183,0) 4(5.183,1.7) 5(5.183,3.4)
  rect 9x11 smd: 6(-5.184,0)

## Nets
As in the schematic.

Pads without a net: U1 1 3 8 16 20 21 23 24 27 28 31 32 35 36 37 38

## Via types
v1: diameter 0.61, hole 0.305, Top Layer to Bottom Layer, 19 vias

## Routing (per net, layer and track width the routed paths; a pad name or vN(x,y) marks a point on that pad's centre or on a via; arc(x,y) is an arc through that point)
5V: length 261.4
  Top Layer w1.5: 72.04,34.12 58.25,34.12 U5.4 ; 52.74,63.37 52.74,71.49 52.25,71.98 16.19,71.98 10.19,65.98 10.19,63.03 9.85,62.68 9.85,62.37 9.6,62.12 9.6,61.74 8.6,60.74 8.29,60.74 4.52,56.97 L2.2 ; 52.74,63.37 56.8,63.37 57.95,64.51 H6.2 H7.2 H8.2 ; 52.74,63.37 52.74,61.37 ; C6.2 14.76,17.54 U3.4 14.77,17.47 14.77,15.4 14.13,14.77 12.1,14.77 11.04,15.83 11.04,19.09 C5.1 6.91,28.35 L2.2 ; 72.45,39.15 72.45,24.18 71.39,23.12 71.38,23.12 U4.1 ; 72.45,39.15 72.45,39.28 68.7,43.02 68.7,45.41 U11.2 54.14,58.96 52.74,60.36 52.74,61.37 ; 72.45,39.15 72.81,51.47 U11.13 ; 48.42,63.41 50.7,63.41 52.74,61.37 ; 23.15,55.28 23.15,55.13 21.46,53.44 21.46,44.42 23.15,42.73 23.15,36.99 15.75,36.99 9.49,30.74 L2.2
GND: length 49.1
  Top Layer w0.254: U10.3 14.35,57.82 LED1.2
  Top Layer w1.5: C3.1 6.92,19.7 C5.2 ; C2.2 18.2,28.91 D3.2 ; U3.5 13.03,21.58 C6.1 12.76,23.56 14.17,24.96 D3.2 ; D3.2 16.43,23.2 U3.3
  vias: v1(15.29,8.28) v1(15.27,7.15) v1(15.27,5.93) v1(16.43,8.28) v1(16.43,7.14) v1(16.43,5.93) v1(17.69,8.28) v1(17.69,7.15) v1(17.69,5.97)
VCC: length 243.8
  Top Layer w1.5: 24.16,17.58 24.16,3.11 22.11,1.05 10.58,1.05 9.81,1.81 9.81,2.83 ; 24.16,17.58 24.16,18.27 24.04,18.4 ; 24.16,17.58 24.09,17.51 U3.1 ; 24.04,18.4 25.18,19.54 25.18,30.59 C2.1 ; 24.04,18.4 27.1,18.4 SW1.1 ; C3.2 9.94,14.1 9.94,2.96 9.81,2.83 ; 9.81,2.83 8.58,4.06 5.71,4.06 3.41,6.36 3.41,6.44 1.43,8.42 1.43,59.21 2.7,60.48 ; 2.7,60.48 5.13,62.9 U10.1 ; 2.7,60.48 2.7,65.83 4.32,67.45 4.32,68.69 4.49,68.86 4.49,69.11 4.7,69.32 arc(5.09,69.99) 5.5,70.65 ; 67.36,64.17 67.79,63.74 68.06,63.74 68.25,63.55 70.03,63.55 70.22,63.74 70.5,63.74 71.94,65.19 71.94,67.52 70.5,68.97 70.47,68.97 arc(69.83,69.92) 68.85,70.52 65.78,73.58 8.96,73.58 5.69,70.31 ; 67.36,64.17 63.16,59.97 56.53,59.97 55.15,61.35 U11.1
AO1: length 20.2
  Top Layer w0.254: CN1.1 18.94,44.25 7.91,55.28
AO2: length 16.6
  Top Layer w0.254: U10.5 16.44,44.21 CN1.2
AO3: length 21
  Top Layer w0.254: U11.4 68.09,40.95 CN3.1
AO4: length 18.6
  Top Layer w0.254: U11.5 57.19,51.34 65.59,42.94 CN3.2
BO1: length 7.5
  Top Layer w0.254: U10.7 8.98,46.59 8.98,44.68 8.18,43.89 CN2.1
BO2: length 10.4
  Top Layer w0.254: 7.91,50.2 10.68,47.43 CN2.2
BO3: length 7.1
  Top Layer w0.254: CN4.1 56.44,44.97 U11.7
BO4: length 10.7
  Top Layer w0.254: U11.6 58.94,45.01 CN4.2
PA0: length 10.2
  Top Layer w0.254: 33.18,58.33 32.67,57.82 U10.14
PA1: length 15.6
  Top Layer w0.254: 23.15,60.36 23.15,59.33 22.08,58.26 22.08,56.73 22.51,56.3 22.66,56.3 22.71,56.35 23.59,56.35 23.64,56.3 32.67,56.3 33.18,55.79
PA4: length 11.9
  Top Layer w0.254: U1.29 27.72,48.17 U10.12
PA5: length 11.9
  Top Layer w0.254: 33.18,45.63 32.93,45.63 30.74,47.81 27.57,47.81 25.19,50.2 23.15,50.2
PA8: length 23.4
  Top Layer w0.254: U4.3 68.49,29.63 54.01,29.63 53.96,29.68 50.67,29.68 49.95,30.39 U1.5
PA9: length 14.2
  Top Layer w0.254: U1.6 50.96,30.39 59.98,30.39 60.8,31.21 U5.2
PA10: length 21.8
  Top Layer w0.254: U5.1 63.21,31.73 62.41,31.73 60.71,30.03 50.81,30.03 49.11,31.73 47.33,31.73 47.15,31.91 47.15,34.2 U1.7
PA15: length 45.5
  Top Layer w0.254: U10.16 23.15,66.79 23.75,67.4 34.45,67.4 41.94,59.9 41.94,50.58 48.42,44.1 U1.10
PB0: length 98.4
  Top Layer w0.254: U1.33 v1(31.45,38.01)
  Bottom Layer w0.254: v1(31.45,38.01) 31.68,38.24 31.68,70.41 35.84,74.57 65,74.57 arc(65.16,74.57) 65.32,74.57 66.56,73.33 66.56,69.43 arc(68.77,69.88) 70.03,68.01 arc(68.77,66.13) 66.56,66.58 66.56,64.32 69.33,61.55 69.33,61.06 69.95,60.44 70.94,60.44 71.97,59.4 71.97,58.52 70.9,57.45 70.9,56.93 U11.14
PB1: length 92.1
  Top Layer w0.254: U1.34 v1(32.04,35.47)
  Bottom Layer w0.254: U11.15 70.77,59.34 70.77,59.73 70.42,60.08 69.8,60.08 68.97,60.91 68.97,61.41 65.92,64.45 65.92,73.47 65.26,74.13 36.03,74.13 32.42,70.52 32.42,69.25 32.1,68.94 32.1,68.04 32.42,67.72 32.42,66.71 32.1,66.39 32.1,65.5 32.42,65.18 32.42,64.17 32.1,63.85 32.1,62.96 32.42,62.64 32.42,61.63 32.1,61.31 32.1,60.42 32.42,60.1 32.42,59.09 32.1,58.77 32.1,57.88 32.42,57.56 32.42,56.55 32.1,56.23 32.1,55.34 32.42,55.02 32.42,54.01 32.1,53.69 32.1,52.8 32.42,52.48 32.42,51.47 32.1,51.16 32.1,50.26 32.42,49.94 32.42,48.93 32.1,48.61 32.1,47.72 32.42,47.4 32.42,46.39 32.1,46.08 32.1,45.18 32.42,44.86 32.42,43.85 32.1,43.53 32.1,42.64 32.42,42.32 32.42,41.31 32.1,40.99 32.1,40.1 32.42,39.78 32.42,38.77 32.1,38.45 32.1,37.56 32.42,37.24 32.42,35.85 v1(32.04,35.47)
PB3: length 32.7
  Top Layer w0.254: U10.10 28.8,42.01 48.87,42.01 49.69,42.83 49.69,44.61 48.68,45.63 48.42,45.63
PB4: length 65.6
  Top Layer w0.254: U1.12 48.42,49.18 45.17,52.43 45.17,70.34 v1(45.12,70.39) ; v1(64.04,58.84) 67.73,58.84 U11.16
  Bottom Layer w0.254: v1(64.04,58.84) 64.04,65.17 64.08,65.21 64.08,71.77 64.04,71.81 64.04,72.3 63.66,72.68 45.63,72.68 45.12,72.17 v1(45.12,70.39)
PB5: length 72.4
  Top Layer w0.254: 48.42,50.71 v1(46.52,52.61)
  Bottom Layer w0.254: v1(46.52,52.61) 46.14,52.99 46.14,65.63 44.54,67.23 44.54,72.09 45.48,73.03 46.11,73.03 46.14,73.06 63.78,73.06 64.4,72.45 64.4,71.95 64.44,71.92 64.44,65.06 64.4,65.02 64.4,59.81 64.65,59.56 64.65,51.75 68.87,47.53 68.87,47.41 70.01,46.26 U11.10
PB6: length 25.5
  Top Layer w0.254: U1.14 48.42,54.26 47.34,55.34 47.34,61.44 45.75,63.03 v1(45.75,67.22)
  Bottom Layer w0.254: v1(45.75,67.22) 53.5,67.22 H6.1
PB7: length 26
  Top Layer w0.254: v1(47.41,69.85) 46.7,69.13 46.7,63.46 48.21,61.95 48.87,61.95 48.88,61.94 49.24,61.94 49.93,61.24 49.93,56.79 48.86,55.71 48.5,55.71 48.42,55.79
  Bottom Layer w0.254: v1(47.41,69.85) 53.66,69.85 H7.1
PB9: length 19.4
  Top Layer w0.254: U1.17 46.34,62.95 46.34,69.98 v1(46.91,70.55)
  Bottom Layer w0.254: v1(46.91,70.55) 55.05,70.55 H8.1
PB12: length 82.5
  Top Layer w0.254: 48.42,40.55 v1(45.63,40.55)
  Bottom Layer w0.254: U11.12 66.2,51.34 65.14,52.41 65.14,72.21 63.93,73.42 45.99,73.42 45.96,73.39 45.33,73.39 44.18,72.24 44.18,54.31 45.63,52.87 v1(45.63,40.55)
PB13: length 105.1
  Top Layer w0.254: 48.42,22.77 v1(46.52,22.77)
  Bottom Layer w0.254: v1(46.52,22.77) 46.52,38.83 43.82,41.53 43.82,72.4 44.74,73.31 44.75,73.31 45.19,73.75 45.82,73.75 45.84,73.77 64.08,73.77 65.57,72.28 65.57,53.25 66.07,52.74 70.9,52.74 71.92,51.72 71.92,50.33 U11.11
PB15: length 24.6
  Top Layer w0.254: U4.2 66.33,29.24 50.83,29.24 49.44,27.85 48.42,27.85
PC13: length 9
  Top Layer w0.254: LED1.1 32.93,65.69 U1.22
$1N1207: length 27.4
  Top Layer w1.5: L2.1 15.12,30.74 18.07,33.69 20.99,33.69 22.26,32.42 22.26,23.15 19.69,20.58 D3.1 18.2,17.57 U3.2
$1N6220: length 14.2
  Top Layer w1.5: 44.48,8.18 44.25,8.42 32.08,8.42 SW1.2

## Copper pours and planes (outline as drawn; the poured copper is in the pictures)
GND on Bottom Layer: 10,75 65,75 75,65 75,10 65,0 10,0 0,10 0,65

## Text on the board
Bottom Silkscreen Layer: 溯回·陌离

# Board PCB2
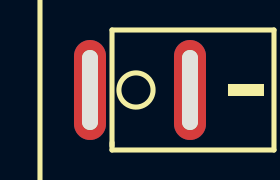
[diagram p4: board, top side]
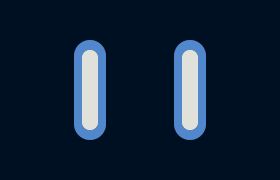
[diagram p5: board, bottom side, seen from below]

No outline. copper layers: Top Layer, Bottom Layer. Coordinates in mm from the lowest, leftmost part position.
Stack: Top Layer 0.035mm / Dielectric1 1.51mm FR4 er 4.5 / Bottom Layer 0.035mm

## Design rules (mm)
spacing copperThickness1oz (default): track to track 0.102, other pairs 0.152 to 0.3
spacing copperThickness2oz: track to track 0.203, other pairs 0.152 to 0.3
spacing Plane_innerPlane: track to track 0.102, other pairs 0.152 to 0.3
spacing Copper_copperRegion: track to track 0.102, other pairs 0.152 to 0.3
track width copperThickness1oz (default): min 0.127, default 0.254, max 2.54
track width copperThickness2oz: min 0.203, default 0.254, max 2.54
differential pair differentialPair (default): width min 0.127, default 0.254, max 2.54; gap min 0.152, default 0.152

## Placement (name value [footprint] x y rotation side)
SW1  HX KCD11-2P-R  [SW-TH_2P-L15.0-W10.5-P5.00_KCD11-2P-R]  0 0 0 top

## Footprints (pads in the part's own frame, mm; a bottom-side part is the same pattern mirrored in y, then rotated)
SW-TH_2P-L15.0-W10.5-P5.00_KCD11-2P-R
  oval 1.6x5 hole 0.8x4: 1(-2.5,0) 2(2.5,0)

## Nets
As in the schematic.

Pads without a net: SW1 1 2
